# Altium schematic sheet Sheet1.SchDoc
size 381 x 241 mm; SheetNumber: 1; SheetTotal: 1
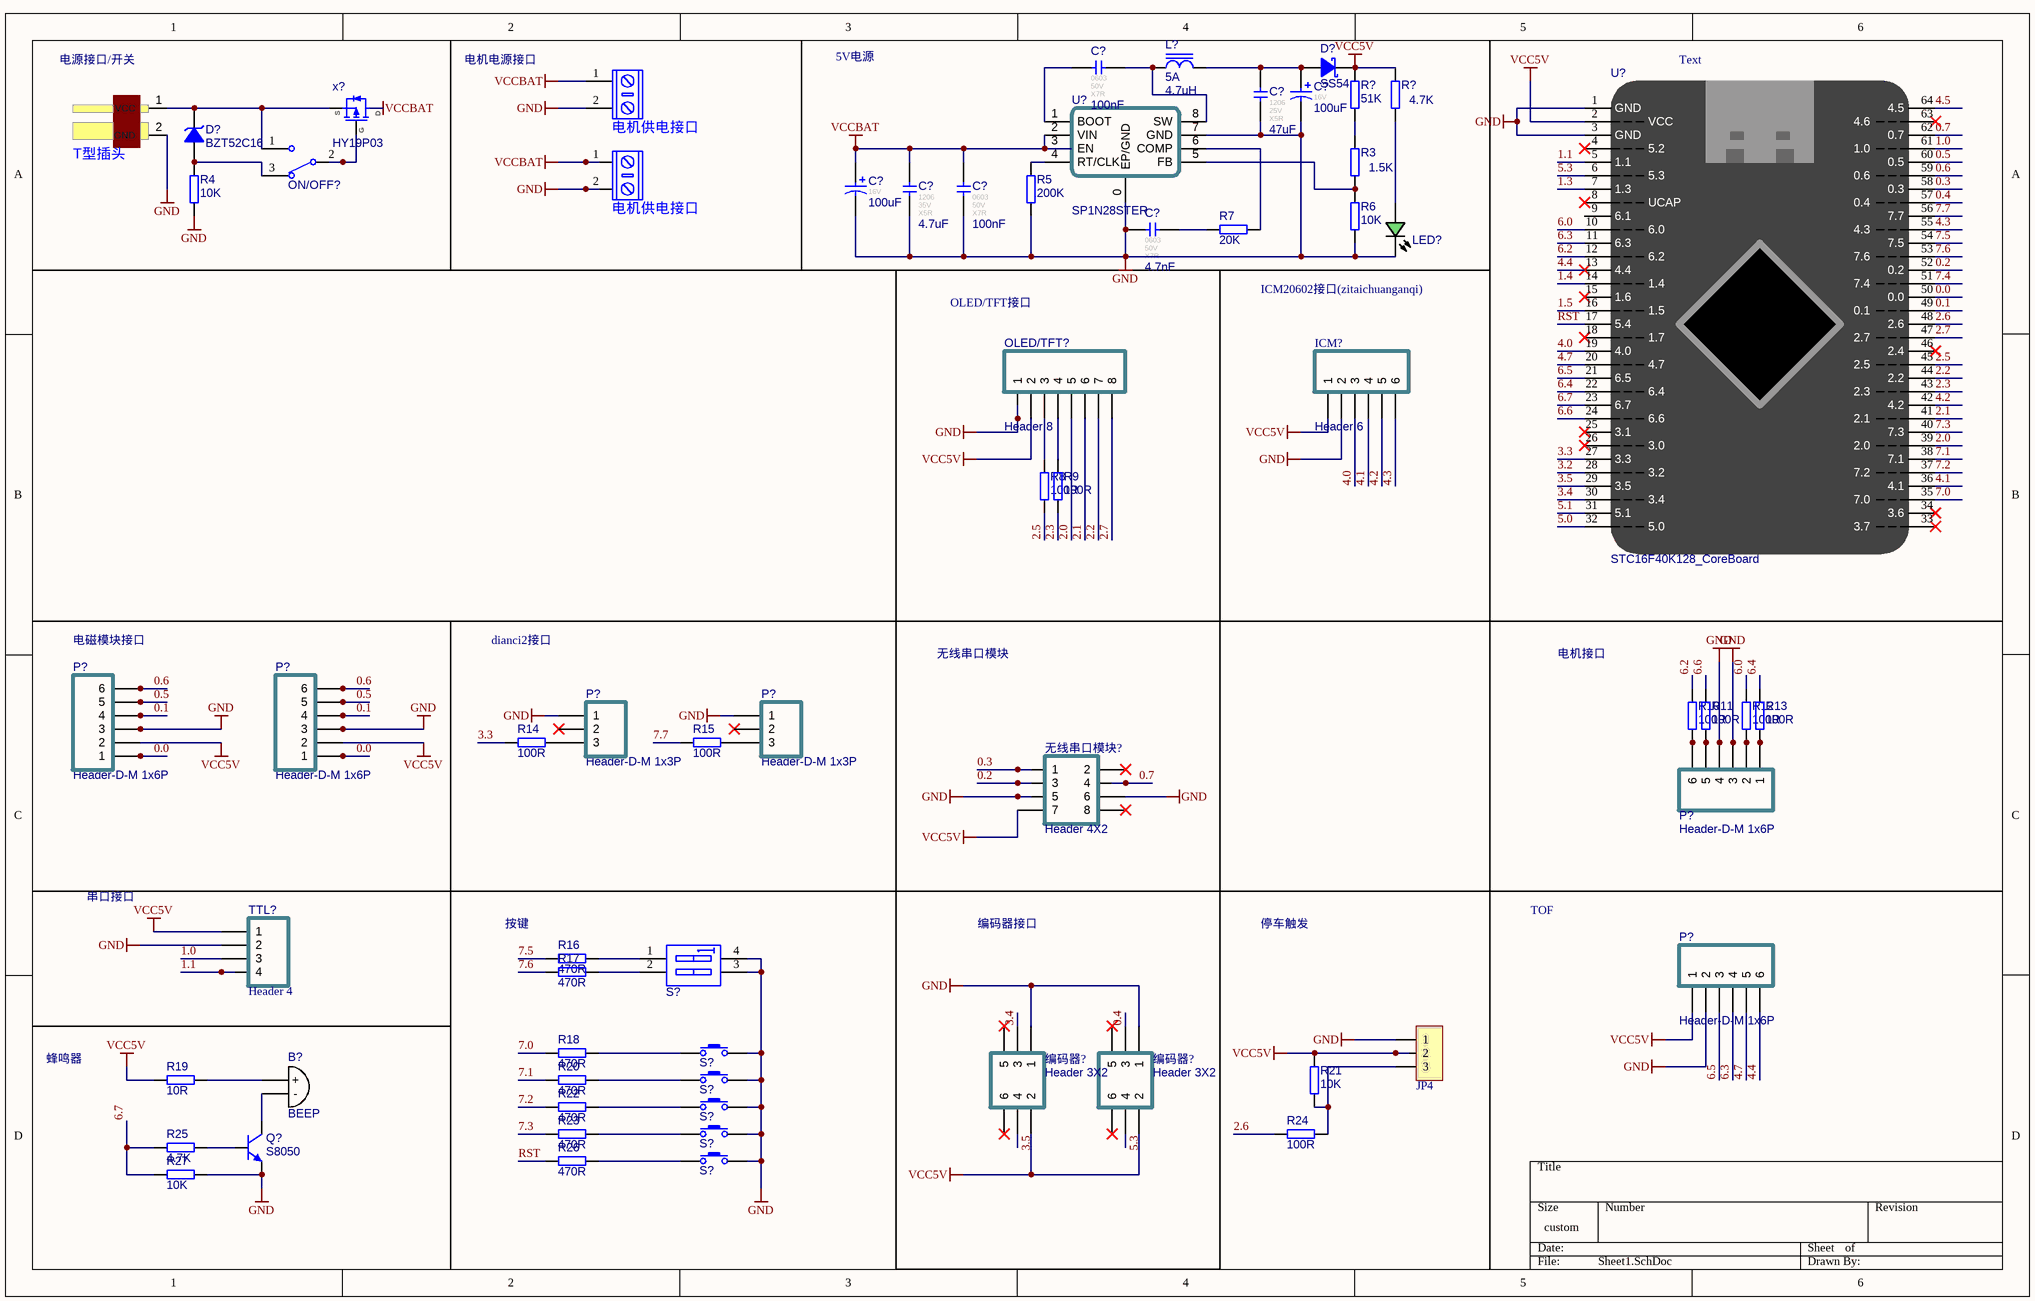
[diagram p0: Sheet1.SchDoc]

## Parts
(Parts that share a designator on the sheet are numbered #1, #2 ... from top to bottom, then left to right.)
B?  BEEP  [BEEP 9x5.5mm]
C?#1  value 100nF  FootPrint: 0603  Voltage: 50V  Type: X7R  [CAPC1608[0603]S-N]  (hidden comment: 100nF 50V X7R)
C?#2  value 100uF  Voltage: 16V  [CAP-E-S 6.3]  (hidden comment: 100uF 16V 铝电解)
C?#3  value 47uF  FootPrint: 1206  Voltage: 25V  Type: X5R  [CAPC3216[1206]S]  (hidden comment: 47uF 25V X5R)
C?#4  value 100uF  Voltage: 16V  [CAP-E-S 6.3]  (hidden comment: 100uF 16V 铝电解)
C?#5  value 4.7uF  FootPrint: 1206  Voltage: 35V  Type: X5R  [CAPC3216[1206]S]  (hidden comment: 4.7uF 35V X5R)
C?#6  value 100nF  FootPrint: 0603  Voltage: 50V  Type: X7R  [CAPC1608[0603]S-N]  (hidden comment: 100nF 50V X7R)
C?#7  value 4.7nF  FootPrint: 0603  Voltage: 50V  Type: X7R  [CAPC1608[0603]S-N]  (hidden comment: 4.7nF 50V X7R)
D?#1  SS54  [SMA-L[DO-214AC]]
D?#2  BZT52C16  [SOD-123-L]
DCIN?  T型插头  [Wired T-Header ThroughHole]
DCOUT1  电机供电接口  [KF/WJ/DG 301-2p-5.0mm]
DCOUT2  电机供电接口  [KF/WJ/DG 301-2p-5.0mm]
ICM?  Header 6  [HDR1X6]
JP4  HDR-1X3  [GH1.25-LT-3P]  (value not drawn)
L?  value 4.7uH  Imax: 5A  [0630 TPC 7*7*3]  (hidden comment: 4.7uH 5A)
LED?  翠绿贴片LED  [LEDC1608(0603)-L]  (value not drawn)
OLED/TFT?  Header 8  [HDR1X8]
ON/OFF?  SW-SPDT  [SS12D10]  (value not drawn)
P?#1  Header-D-M 1x3P  [HDR1X3-M]
P?#2  Header-D-M 1x3P  [HDR1X3-M]
P?#3  Header-D-M 1x6P  [HDR1X6-M]
P?#4  Header-D-M 1x6P  [HDR1X6-M]
P?#5  Header-D-M 1x6P  [HDR1X6-M]
P?#6  Header-D-M 1x6P  [HDR1X6-M]
Q?  S8050  [SOT-23]
R3  value 1.5K  [RESC1608[0603]S-N]  (hidden comment: 1.5K ±1%)
R4  value 10K  [RESC1608[0603]S-N]  (hidden comment: 10K ±1%)
R5  value 200K  [RESC1608[0603]S-N]  (hidden comment: 200K ±1%)
R6  value 10K  [RESC1608[0603]S-N]  (hidden comment: 10K ±1%)
R7  value 20K  [RESC1608[0603]S-N]  (hidden comment: 20K ±1%)
R8  value 100R  [RESC1608[0603]S-N]  (hidden comment: 100R ±1%)
R9  value 100R  [RESC1608[0603]S-N]  (hidden comment: 100R ±1%)
R10  value 100R  [RESC1608[0603]S-N]  (hidden comment: 100R ±1%)
R11  value 100R  [RESC1608[0603]S-N]  (hidden comment: 100R ±1%)
R12  value 100R  [RESC1608[0603]S-N]  (hidden comment: 100R ±1%)
R13  value 100R  [RESC1608[0603]S-N]  (hidden comment: 100R ±1%)
R14  value 100R  [RESC1608[0603]S-N]  (hidden comment: 100R ±1%)
R15  value 100R  [RESC1608[0603]S-N]  (hidden comment: 100R ±1%)
R16  value 470R  [RESC1608[0603]S-N]  (hidden comment: 470R ±1%)
R17  value 470R  [RESC1608[0603]S-N]  (hidden comment: 470R ±1%)
R18  value 470R  [RESC1608[0603]S-N]  (hidden comment: 470R ±1%)
R19  value 10R  [RESC1608[0603]S-N]  (hidden comment: 10R ±1%)
R20  value 470R  [RESC1608[0603]S-N]  (hidden comment: 470R ±1%)
R21  value 10K  [RESC1608[0603]S-N]  (hidden comment: 10K ±1%)
R22  value 470R  [RESC1608[0603]S-N]  (hidden comment: 470R ±1%)
R23  value 470R  [RESC1608[0603]S-N]  (hidden comment: 470R ±1%)
R24  value 100R  [RESC1608[0603]S-N]  (hidden comment: 100R ±1%)
R25  value 4.7K  [RESC1608[0603]S-N]  (hidden comment: 4.7K ±1%)
R26  value 470R  [RESC1608[0603]S-N]  (hidden comment: 470R ±1%)
R27  value 10K  [RESC1608[0603]S-N]  (hidden comment: 10K ±1%)
R?#1  value 51K  [RESC1608[0603]S-N]  (hidden comment: 51K ±1%)
R?#2  value 4.7K  [RESC1608[0603]S-N]  (hidden comment: 4.7K ±1%)
S?#1  SW DIP-2  [DIP4]  (value not drawn)
S?#2  Button  [PTS810-3*4-CurvePin]  (value not drawn)
S?#3  Button  [PTS810-3*4-CurvePin]  (value not drawn)
S?#4  Button  [PTS810-3*4-CurvePin]  (value not drawn)
S?#5  Button  [PTS810-3*4-CurvePin]  (value not drawn)
S?#6  Button  [PTS810-3*4-CurvePin]  (value not drawn)
TTL?  Header 4  [HDR1X4]
U?#1  STC16F40K128_CoreBoard  [STC16F40K128_CoreBoard]
U?#2  SP1N28STER  [SOP-8E]
x?  HY19P03  [TO-252AA]
无线串口模块?  Header 4X2  [Female-Header-2.54-SMD-8]
编码器?#1  Header 3X2  [HDR2X3-M-SMT]
编码器?#2  Header 3X2  [HDR2X3-M-SMT]

## Nets
GND: C?#2.2 C?#3.1 C?#4.2 C?#5.1 C?#6.1 C?#7.1 DCIN?.2(GND) DCOUT1.2 DCOUT2.2 ICM?.2 JP4.1 LED?.C OLED/TFT?.1 P?#1.1 P?#2.1 P?#3.3 P?#4.3 P?#5.3 P?#5.4 P?#6.2 Q?.2(E) R4.1 R5.1 R6.1 R27.2 S?#1.3(B2) S?#1.4(B1) S?#2.1 S?#3.1 S?#4.1 S?#5.1 S?#6.1 TTL?.2 U?#1.1(GND) U?#1.3(GND) U?#2.0(EP/GND) U?#2.7(GND) 无线串口模块?.5 无线串口模块?.6 编码器?#1.1 编码器?#2.1
VCC5V: D?#1.K ICM?.1 JP4.2 OLED/TFT?.2 P?#3.2 P?#4.2 P?#6.1 R19.1 R21.2 R?#1.2 R?#2.2 TTL?.1 U?#1.2(VCC) 无线串口模块?.7 编码器?#1.2 编码器?#2.2
VCCBAT: C?#4.1 C?#5.2 C?#6.2 DCOUT1.1 DCOUT2.1 U?#2.2(VIN) U?#2.3(EN) x?.1(D)
0.0: P?#3.1 P?#4.1 U?#1.50(0.0)
0.1: P?#3.4 P?#4.4 U?#1.49(0.1)
0.2: U?#1.52(0.2) 无线串口模块?.3
0.3: U?#1.58(0.3) 无线串口模块?.1
0.4: U?#1.57(0.4) 编码器?#2.3
0.5: P?#3.5 P?#4.5 U?#1.60(0.5)
0.6: P?#3.6 P?#4.6 U?#1.59(0.6)
0.7: U?#1.62(0.7) 无线串口模块?.4
1.0: TTL?.3 U?#1.61(1.0)
1.1: TTL?.4 U?#1.5(1.1)
1.3: U?#1.7(1.3)
1.4: U?#1.14(1.4)
1.5: U?#1.16(1.5)
2.0: OLED/TFT?.5 U?#1.39(2.0)
2.1: OLED/TFT?.6 U?#1.41(2.1)
2.2: OLED/TFT?.7 U?#1.44(2.2)
2.3: R9.1 U?#1.43(2.3)
2.5: R8.1 U?#1.45(2.5)
2.6: R24.2 U?#1.48(2.6)
2.7: OLED/TFT?.8 U?#1.47(2.7)
3.2: U?#1.28(3.2)
3.3: R14.1 U?#1.27(3.3)
3.4: U?#1.30(3.4) 编码器?#1.3
3.5: U?#1.29(3.5) 编码器?#1.4
4.0: ICM?.3 U?#1.19(4.0)
4.1: ICM?.4 U?#1.36(4.1)
4.2: ICM?.5 U?#1.42(4.2)
4.3: ICM?.6 U?#1.55(4.3)
4.4: P?#6.6 U?#1.13(4.4)
4.5: U?#1.64(4.5)
4.7: P?#6.5 U?#1.20(4.7)
5.0: U?#1.32(5.0)
5.1: U?#1.31(5.1)
5.3: U?#1.6(5.3) 编码器?#2.4
6.0: R12.2 U?#1.10(6.0)
6.2: R10.2 U?#1.12(6.2)
6.3: P?#6.4 U?#1.11(6.3)
6.4: R13.2 U?#1.22(6.4)
6.5: P?#6.3 U?#1.21(6.5)
6.6: R11.2 U?#1.24(6.6)
6.7: R25.1 R27.1 U?#1.23(6.7)
7.0: R18.1 U?#1.35(7.0)
7.1: R20.1 U?#1.38(7.1)
7.2: R22.1 U?#1.37(7.2)
7.3: R23.1 U?#1.40(7.3)
7.4: U?#1.51(7.4)
7.5: R16.1 U?#1.54(7.5)
7.6: R17.1 U?#1.53(7.6)
7.7: R15.1 U?#1.56(7.7)
RST: R26.1 U?#1.17(5.4)
NetB?_1: B?.1(+) R19.2
NetB?_2: B?.2(-) Q?.3(C)
NetC?#1_1: C?#1.1 U?#2.1(BOOT)
NetC?#1_2: C?#1.2 L?.1 U?#2.8(SW)
NetC?#2_1: C?#2.1 C?#3.2 D?#1.A L?.2
NetC?#7_2: C?#7.2 R7.1
NetD?#2_A: D?#2.A ON/OFF?.3 R4.2
NetD?#2_K: D?#2.K DCIN?.1(VCC) ON/OFF?.1 x?.3(S)
NetJP4_3: JP4.3 R21.1 R24.1
NetLED?_A: LED?.A R?#2.1
NetOLED/TFT?_3: OLED/TFT?.3 R8.2
NetOLED/TFT?_4: OLED/TFT?.4 R9.2
NetON/OFF?_2: ON/OFF?.2 x?.2(G)
NetP?#1_3: P?#1.3 R14.2
NetP?#2_3: P?#2.3 R15.2
NetP?#5_1: P?#5.1 R13.1
NetP?#5_2: P?#5.2 R12.1
NetP?#5_5: P?#5.5 R11.1
NetP?#5_6: P?#5.6 R10.1
NetQ?_1: Q?.1(B) R25.2
NetR3_1: R3.1 R6.2 U?#2.5(FB)
NetR3_2: R3.2 R?#1.1
NetR5_2: R5.2 U?#2.4(RT/CLK)
NetR7_2: R7.2 U?#2.6(COMP)
NetR16_2: R16.2 S?#1.1(A1)
NetR17_2: R17.2 S?#1.2(A2)
NetR18_2: R18.2 S?#2.2
NetR20_2: R20.2 S?#3.2
NetR22_2: R22.2 S?#4.2
NetR23_2: R23.2 S?#5.2
NetR26_2: R26.2 S?#6.2

Not connected (* = marked no-connect by the designer): P?#1 2*; P?#2 2*; U?#1 4(5.2)* 8(UCAP)* 9(6.1) 15(1.6)* 18(1.7)* 25(3.1)* 26(3.0)* 33(3.7)* 34(3.6)* 46(2.4)* 63(4.6)*; 无线串口模块? 2* 8*; 编码器?#1 5* 6*; 编码器?#2 5* 6*

## Notes on the sheet
- 电源接口/开关
- 电机电源接口
- 5V电源
- (near U?#1) Text
- OLED/TFT接口
- ICM20602接口(zitaichuanganqi)
- (near P?#3) 电磁模块接口
- dianci2接口
- 无线串口模块
- 电机接口
- 串口接口
- TOF
- 按键
- 编码器接口
- 停车触发
- 蜂鸣器

## Library data of the parts
B? = BEEP: 蜂鸣器
C?#1 C?#6 = 100nF 0603 50V X7R: 贴片瓷片电容; MLCC; 0603(1608);; Revision: V1.0
C?#2 C?#4 = E-S 220uF 25V 6.3x7.7: 贴片电解电容 100uF 16V 6.3x5.4; Revision: V1.0; Type: 铝电解
C?#3 = 47uF 1206 25V X5R: 贴片瓷片电容; MLCC; 1206(3216);; Revision: V1.0
C?#5 = 4.7uF 1206 35V X5R: 贴片瓷片电容; MLCC; 1206(3216);; Revision: V1.0
C?#7 = 4.7nF 0603 50V X7R: 贴片瓷片电容; MLCC; 0603(1608);; Revision: V1.0
D?#1 = SS54: SS54 肖特基二极管; Revision: V1.0; Value: SS54
D?#2 = Diode TVS Uni-Dir: TRANSIENT VOLTAGE  SUPPRESSOR DIODE; Imax: 500mA; Published: 8-Jun-2000; Publisher: Altium Limited; Price(RMB): 0.000
DCIN? = T_Header
DCOUT1 DCOUT2 = KF/WJ/DG 30x: 接线端子 2Pin
ICM? = Header 6: Header, 6-Pin; LatestRevisionDate: 17-Jul-2002; LatestRevisionNote: Re-released for DXP Platform.; Publisher: Altium Limited; Price(RMB): 0.00
JP4 = Header 3: 3P连接器; 联系卖家 免费技术支持: 封装库来自淘宝卖家ID：黄晶宝石; BOM名称: 3P连接器
L? = Ind-Power: 功率电感; DCR: .5m; Published: 8-Jun-2000; Revision: July-2002: Re-released for DXP Platform.; Publisher: Altium Limited; Price(RMB): 0.000
LED? = LED Chip Green: Published: 8-Jun-2000; Revision: July-2002: Re-released for DXP Platform.; Publisher: Altium Limited; Price(RMB): 0.00
OLED/TFT? = Header 8: Header, 8-Pin; LatestRevisionDate: 17-Jul-2002; LatestRevisionNote: Re-released for DXP Platform.; Publisher: Altium Limited; Price(RMB): 0.00
ON/OFF? = SW-SPDT: 单刀双掷开关 3脚船型、钮子、拨动开关 SPDT Subminiature Toggle Switch; Published: 24-Mar-1999; Publisher: Altium Limited; Price(RMB): 0.000
P?#1 P?#2 = Header-D-M 1x3P: 1x3pin, 直插, 排针; Revision: V1.0; Value: Header-D-M 1x3P
P?#3-P?#6 = Header-D-M 1x6P: 1x6pin, 直插, 排针; Revision: V1.0; Value: Header-D-M 1x6P
Q? = NPN S8050: Discrete NPN Bipolar Transistor; Published: 8-Jun-2000; Revision: July-2002: Re-released for DXP Platform.; Publisher: Altium Limited; Price(RMB): 0.000; PartNumber: S8050
R3 R6 R?#1 R?#2 = Res-Chip_7: 贴片电阻; Power: 1/8W; Revision: V1.0; Tolerance: ±1%
R4 = Res-Chip_4: 贴片电阻; Published: 8-Jun-2000; Revision: July-2002: Re-released for DXP Platform.; Publisher: Altium Limited; Price(RMB): 0.000; Tolerance: ±1%
R5 R7 = Res-Chip_1: 贴片电阻; Power: 1/8W; Revision: V1.0; Tolerance: ±1%
R8 R9 R24 = Res-Chip_5: 贴片电阻; Published: 8-Jun-2000; Revision: July-2002: Re-released for DXP Platform.; Publisher: Altium Limited; Price(RMB): 0.000; Tolerance: ±1%
R10-R15 = Res-Chip_9: 贴片电阻; Power: 1/8W; Revision: V1.0; Tolerance: ±1%
R16-R18 R20 R22 R23 R26 = Res-Chip_8: 贴片电阻; Published: 8-Jun-2000; Revision: July-2002: Re-released for DXP Platform.; Publisher: Altium Limited; Price(RMB): 0.000; Tolerance: ±1%
R19 = Res-Chip_6: 贴片电阻; Published: 8-Jun-2000; Revision: July-2002: Re-released for DXP Platform.; Publisher: Altium Limited; Price(RMB): 0.000; Tolerance: ±1%
R21 = Res-Chip_2: 贴片电阻; Power: 1/8W; Revision: V1.0; Tolerance: ±1%
R25 = Res-Chip: 贴片电阻; Published: 8-Jun-2000; Revision: July-2002: Re-released for DXP Platform.; Publisher: Altium Limited; Price(RMB): 0.000; Tolerance: ±1%
R27 = Res-Chip_3: 贴片电阻; Published: 8-Jun-2000; Revision: July-2002: Re-released for DXP Platform.; Publisher: Altium Limited; Price(RMB): 0.000; Tolerance: ±1%
S?#1 = Code SW-2: 2位拨码开关; Published: 24-Mar-1999; Revision: July-2002: Re-released for DXP Platform.; Publisher: Altium Limited; Price(RMB): 0.000
S?#2-S?#6 = KEY: 按键; Published: 24-Mar-1999; Publisher: Altium Limited; Price(RMB): 0.000
TTL? = Header 4: Header, 4-Pin; LatestRevisionDate: 17-Jul-2002; LatestRevisionNote: Re-released for DXP Platform.; Publisher: Altium Limited; Price(RMB): 0.00
U?#1 = STC16F40K128_CoreBoard: 逐飞科技 STC16F40K128核心板
x? = HY19P03: HY19P03 P-Channel MOSFET
无线串口模块? = Header 4X2: Header, 4-Pin, Dual row; LatestRevisionDate: 17-Jul-2002; LatestRevisionNote: Re-released for DXP Platform.; Publisher: Altium Limited; Price(RMB): 0.00
编码器?#1 编码器?#2 = Header 3X2: Header, 3-Pin, Dual row; LatestRevisionDate: 17-Jul-2002; LatestRevisionNote: Re-released for DXP Platform.; Publisher: Altium Limited; Price(RMB): 0.00
U?#2 = SP1N28STER: Revision: V1.0; Value: SP1N28STER